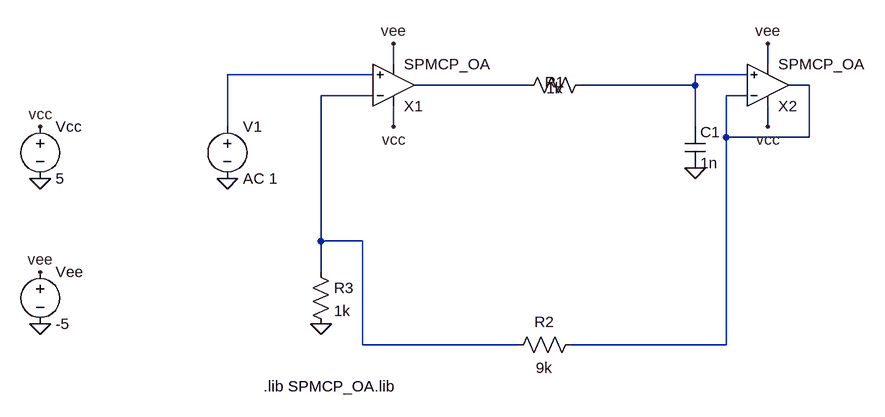
[diagram p0: schematic unseen_two_stage.asc]
unseen_two_stage.asc, the LTspice schematic file:
Version 4.1
SHEET 1 1600 1200
WIRE 400 0 224 0
WIRE 160 -16 -64 -16
WIRE -64 -16 -64 64
WIRE 656 64 656 0
WIRE 656 0 480 0
WIRE 736 -16 656 -16
WIRE 656 -16 656 0
WIRE 160 16 80 16
WIRE 80 16 80 240
WIRE 80 240 80 288
WIRE 384 400 144 400
WIRE 144 400 144 240
WIRE 144 240 80 240
WIRE 736 16 704 16
WIRE 704 16 704 80
WIRE 704 80 704 400
WIRE 704 400 464 400
WIRE 800 0 832 0
WIRE 832 0 832 80
WIRE 832 80 704 80
WIRE 192 32 192 64
WIRE 768 32 768 64
WIRE 192 -32 192 -64
WIRE 768 -32 768 -64
FLAG -352 64 vcc
FLAG -352 288 vee
FLAG 192 64 vcc
FLAG 192 -64 vee
FLAG 768 64 vcc
FLAG 768 -64 vee
FLAG -64 144 0
FLAG 656 128 0
FLAG 80 368 0
FLAG -352 144 0
FLAG -352 368 0
SYMBOL OpAmps\\opamp2 192 64 M180
SYMATTR InstName X1
SYMATTR Value SPMCP_OA
SYMBOL OpAmps\\opamp2 768 64 M180
SYMATTR InstName X2
SYMATTR Value SPMCP_OA
SYMBOL res 384 16 R270
WINDOW 0 36 56 VBottom 2
WINDOW 3 -4 56 VTop 2
SYMATTR InstName R1
SYMATTR Value 1k
SYMBOL res 480 384 R90
WINDOW 0 -4 56 VBottom 2
WINDOW 3 36 56 VTop 2
SYMATTR InstName R2
SYMATTR Value 9k
SYMBOL cap 640 64 R0
SYMATTR InstName C1
SYMATTR Value 1n
SYMBOL res 64 272 R0
SYMATTR InstName R3
SYMATTR Value 1k
SYMBOL voltage -64 48 R0
SYMATTR InstName V1
SYMATTR Value AC 1
SYMBOL voltage -352 48 R0
SYMATTR InstName Vcc
SYMATTR Value 5
SYMBOL voltage -352 272 R0
SYMATTR InstName Vee
SYMATTR Value -5
TEXT -8 464 Left 2 !.lib SPMCP_OA.lib

The netlist it stands for:
* unseen_two_stage.asc
X§X1 N002 N004 vcc vee N001 SPMCP_OA  ; pins In+ In- V+ V- OUT
X§X2 N003 N005 vcc vee N005 SPMCP_OA  ; pins In+ In- V+ V- OUT
R1 N001 N003 1k
R2 N005 N004 9k
C1 N003 0 1n
R3 N004 0 1k
V1 N002 0 AC 1
Vcc vcc 0 5
Vee vee 0 -5
.lib SPMCP_OA.lib
.backanno
.end